# Altium project BOB.PrjPcb (part 1 of 2)
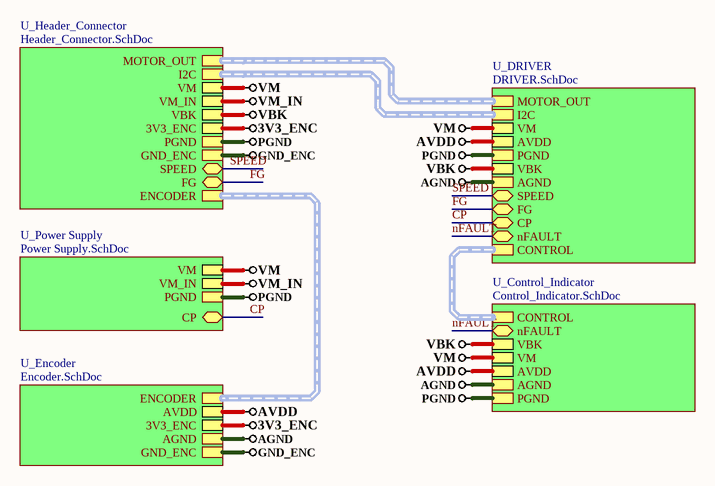
[diagram p0: Top_Sheet.SchDoc]
6 sheets, 57 parts. Net scope: hierarchical (ports join the sheet entries above them; power ports are global).
Board file: PCB_BOB.PcbDoc
Sheets:
  Top_Sheet.SchDoc
    U_Control_Indicator = Control_Indicator.SchDoc
    U_Encoder = Encoder.SchDoc
    U_Power Supply = Power Supply.SchDoc
    U_Header_Connector = Header_Connector.SchDoc
    U_DRIVER = DRIVER.SchDoc

## Sheet Top_Sheet.SchDoc
size A4; DocumentNumber: 1; SheetNumber: 1; SheetTotal: 6

### Sub-sheets
U_Control_Indicator = Control_Indicator.SchDoc: VM, AVDD, PGND, VBK, AGND, CONTROL (harness CONTROL), nFAULT (bidir)
U_DRIVER = DRIVER.SchDoc: I2C (harness I2C), VM, AVDD, PGND, VBK, AGND, CONTROL (harness CONTROL), FG (bidir), nFAULT (bidir), CP (bidir), SPEED (bidir), MOTOR_OUT (harness MOTOR_OUT)
U_Encoder = Encoder.SchDoc: ENCODER (harness ENCODER), AVDD, AGND, 3V3_ENC, GND_ENC
U_Header_Connector = Header_Connector.SchDoc: MOTOR_OUT (harness MOTOR_OUT), VM, VBK, VM_IN, I2C (harness I2C), FG (bidir), ENCODER (harness ENCODER), SPEED (bidir), 3V3_ENC, PGND, GND_ENC
U_Power Supply = Power Supply.SchDoc: VM, VM_IN, PGND, CP (bidir)

### Nets
3V3_ENC: sheet U_Encoder/3V3_ENC, sheet U_Header_Connector/3V3_ENC
AGND: sheet U_Control_Indicator/AGND, sheet U_Encoder/AGND, sheet U_DRIVER/AGND
AVDD: sheet U_Control_Indicator/AVDD, sheet U_Encoder/AVDD, sheet U_DRIVER/AVDD
GND_ENC: sheet U_Encoder/GND_ENC, sheet U_Header_Connector/GND_ENC
PGND: sheet U_Control_Indicator/PGND, sheet U_Power Supply/PGND, sheet U_Header_Connector/PGND, sheet U_DRIVER/PGND
VBK: sheet U_Control_Indicator/VBK, sheet U_Header_Connector/VBK, sheet U_DRIVER/VBK
VM: sheet U_Control_Indicator/VM, sheet U_Power Supply/VM, sheet U_Header_Connector/VM, sheet U_DRIVER/VM
VM_IN: sheet U_Power Supply/VM_IN, sheet U_Header_Connector/VM_IN
CP: sheet U_Power Supply/CP, sheet U_DRIVER/CP
FG: sheet U_Header_Connector/FG, sheet U_DRIVER/FG
nFAULT: sheet U_Control_Indicator/nFAULT, sheet U_DRIVER/nFAULT
SPEED: sheet U_Header_Connector/SPEED, sheet U_DRIVER/SPEED

### Buses and harness runs
harness sheet U_Control_Indicator/CONTROL = sheet U_DRIVER/CONTROL
harness sheet U_DRIVER/I2C = sheet U_Header_Connector/I2C
harness sheet U_DRIVER/MOTOR_OUT = sheet U_Header_Connector/MOTOR_OUT
harness sheet U_Encoder/ENCODER = sheet U_Header_Connector/ENCODER

### Notes on the sheet
- File:
- Title:
- Date:
- Page
- Num:
- Total:
- Drawn By: Huzaifa Ali

## Sheet Control_Indicator.SchDoc
size A4; DocumentNumber: 5; SheetNumber: 5; SheetTotal: 6
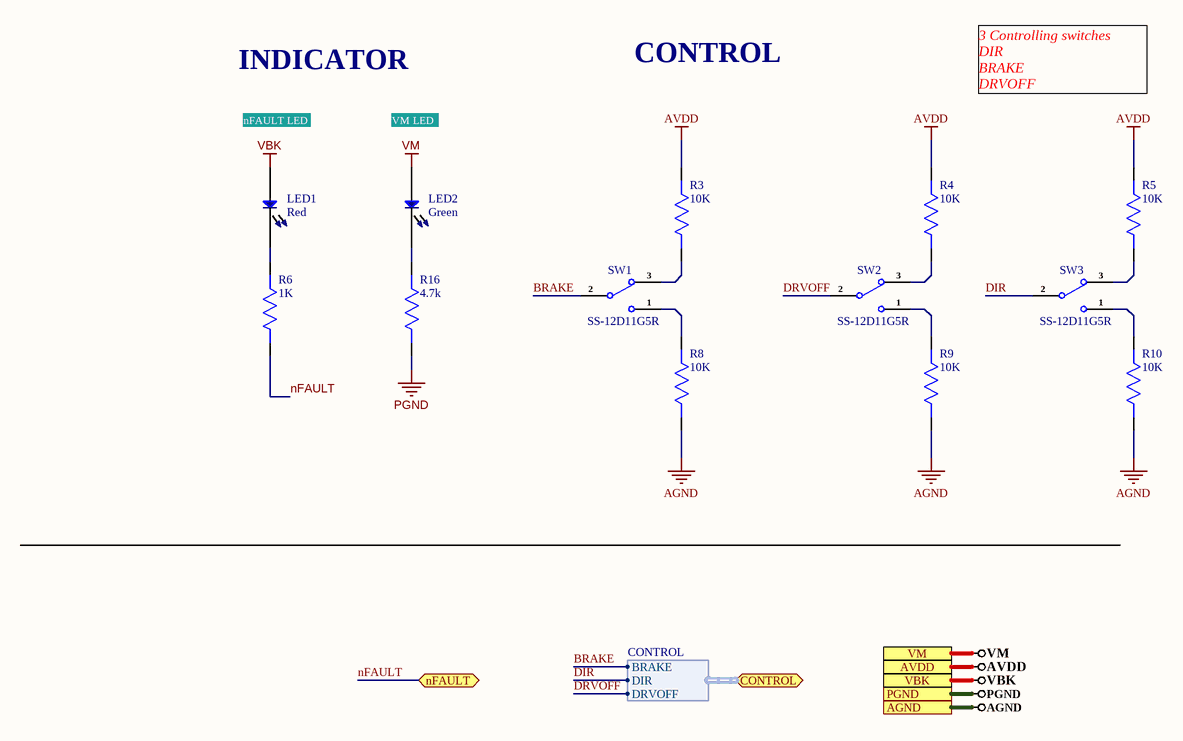
[diagram p1: Control_Indicator.SchDoc]

### Parts
LED1  Red  [LED 0402]
LED2  Green  [LED-0402]
R3  10K  [Res-0603]
R4  10K  [Res-0603]
R5  10K  [Res-0603]
R6  1K  [Res0402]
R8  10K  [Res-0603]
R9  10K  [Res-0603]
R10  10K  [Res-0603]
R16  4.7k  [RES-0805]
SW1  SS-12D11G5R  [SS-12D11G5R_]
SW2  SS-12D11G5R  [SS-12D11G5R_]
SW3  SS-12D11G5R  [SS-12D11G5R_]

### Ports
AGND, AVDD, CONTROL (bidir, harness CONTROL), nFAULT (bidir), PGND, VBK, VM

### Harnesses
CONTROL: BRAKE, DIR, DRVOFF

### Nets
AGND: R8.2 R9.2 R10.2 ; port AGND
AVDD: R3.1 R4.1 R5.1 ; port AVDD
PGND: R16.2 ; port PGND
VBK: LED1.1 ; port VBK
VM: LED2.1 ; port VM
BRAKE: SW1.2 ; port CONTROL.BRAKE
DIR: SW3.2 ; port CONTROL.DIR
DRVOFF: SW2.2 ; port CONTROL.DRVOFF
nFAULT: R6.2 ; port nFAULT
NetLED1_2: LED1.2 R6.1
NetLED2_2: LED2.2 R16.1
NetR3_2: R3.2 SW1.3
NetR4_2: R4.2 SW2.3
NetR5_2: R5.2 SW3.3
NetR8_1: R8.1 SW1.1
NetR9_1: R9.1 SW2.1
NetR10_1: R10.1 SW3.1

### Notes on the sheet
- INDICATOR
- CONTROL
- 3 Controlling switches
  DIR
  BRAKE
  DRVOFF
- nFAULT LED
- VM LED
- File:
- Title:
- Date:
- Page
- Num:
- Total:
- Drawn By: Huzaifa Ali

### Library data of the parts
LED1 = LTST-C281KRKT: Standard LEDs - SMD SMD LED Red 631nm 54mcd 130VA; Manufacturer: Vishay Lite-On; Lens Color: Colorless; Lens Style: Diffused,Colorless,Rectangular,Clear; Viewing Angle: 130°; Forward Current: 20mA; Forward Voltage: 2V; Lens Transparency: Clear; Number of Elements: 1; Power Dissipation: 62.5mW; Reverse Voltage: 5V; Supplier 1: Mouser; Manufacturer Part Number: LTST-C281KRKT; Stock 1: 2790; Pricing 1: 1=0.45, 10=0.25, 100=0.114, 1000=0.082, 3000=0.064, 9000=0.057 (USD); Mount: Surface Mount; Case/Package: 0402; Number of Pins: 2; Color: Red; Case Code (Metric): 1005; Case Code (Imperial): 0402; Min Operating Temperature: -30°C; Max Operating Temperature: 85°C; Package Quantity: 3000; Illumination Color: Red; Luminous Intensity: 54mcd; Packaging: Tape and Reel; Test Current: 20mA; Dominant Wavelength: 631nm; Number of LEDs: 1; Length: 1mm; Height: 0.35mm; Width: 0.5mm; Depth: 0.5mm; Lead Free: Lead Free; ComponentLink1URL: http://optoelectronics.liteon.com/ja-jp/api/DwonloadFileHandler.ashx?txtSpecNo=DS22-2008-0117&txtPartNo=LTST-C281KRKT&src-supplier=Avnet; ComponentLink1Description: http://optoelectronics.liteon.com/ja-jp/api/DwonloadFileHandler.ashx?txtSpecNo=DS22-2008-0117&txtPartNo=LTST-C281KRKT&src-supplier=Avnet; ComponentLink2URL: http://components.arrow.com/part/dataview/52218614S9812790N1331?src-supplier=Arrow; ComponentLink2Description: http://components.arrow.com/part/dataview/52218614S9812790N1331?src-supplier=Arrow; ComponentLink3URL: http://www.mouser.com/ds/2/239/LTST-C281KRKT-1141717.pdf?src-supplier=Mouser; ComponentLink3Description: http://www.mouser.com/ds/2/239/LTST-C281KRKT-1141717.pdf?src-supplier=Mouser; ComponentLink4URL: http://optoelectronics.liteon.com/upload/download/DS22-2008-0117/P_100_LTST-C281KRKT.pdf?src-supplier=Future+Electronics; ComponentLink4Description: http://optoelectronics.liteon.com/upload/download/DS22-2008-0117/P_100_LTST-C281KRKT.pdf?src-supplier=Future+Electronics; ComponentLink5URL: http://optoelectronics.liteon.com/upload/download/DS22-2008-0117/LTST-C281KRKT.pdf?src-supplier=Digi-Key; ComponentLink5Description: http://optoelectronics.liteon.com/upload/download/DS22-2008-0117/LTST-C281KRKT.pdf?src-supplier=Digi-Key; Supplier Part Number 1: 859-LTST-C281KRKT
LED2 = 16-213/GHC-YR1S1/3T: Green 520~535nm 0402 Light Emitting Diodes (LED) RoHS; Manufacturer: Everlight Elec; Luminous Intensity (IF=20mA): 112~285mcd; Package: 0402; Illumination Color: Green; Dominant Wavelength / Coordinate rank: 520~535nm; Mounting Type: Surface Mount; Manufacturer Part Number: 16-213/GHC-YR1S1/3T; ComponentLink1Description: LCSC; ComponentLink1URL: https://www.lcsc.com/product-detail/Light-Emitting-Diodes-LED_Everlight-Elec-16-213-GHC-YR1S1-3T_C74338.html; LCSC Part Number: C74338
R3-R5 R8-R10 = AC0603JR-0710KL: RES SMD 10K OHM 5% 1/10W 0603; Manufacturer: Yageo; Voltage Rating: 50V; Resistance: 10kR; Power Rating: 100mW; Temperature Coefficient: 100ppm/°C; Supplier 1: Future Electronics; Manufacturer Part Number: AC0603JR-0710KL; RoHS: Yes; Category: Chip SMD Resistors; Stock 1: 1533000; Pricing 1: 5000=0.00540 (USD); Case/Package: 0603; Case Code (Imperial): 0603; Case Code (Metric): 1608; Size Code: 0603; Min Operating Temperature: -55°C; Max Operating Temperature: 155°C; Packaging: Tape and Reel; Tolerance: 5%; Package Quantity: 1; Resistor Type: Thick Film; Termination: SMD/SMT; Number of Terminations: 2; Max Power Dissipation: 100mW; Features: Moisture Resistant,Automotive AEC-Q200,Anti-Sulfur; Series: AC; Construction: Rectangular; Length: 0.063inch; Width: 0.031inch; Height: 0.022inch; Depth: 0.8mm; Military Standard: Not; Lead Free: Lead Free; RoHS Compliant: Yes; ComponentLink1URL: https://datasheet.ciiva.com/5562/pyu-ac-51-rohs-l-2-5562553.pdf?src-supplier=Mouser; ComponentLink1Description: https://datasheet.ciiva.com/5562/pyu-ac-51-rohs-l-2-5562553.pdf?src-supplier=Mouser; Supplier Part Number 1: 1029044; LCSC Part Number: C140867
R6 = ERJ-2GEJ102X: RES SMD 1K OHM 5% 1/10W 0402; Manufacturer: Panasonic; Resistance: 1kR; Temperature Coefficient: 200ppm/°C; Voltage Rating: 50V; Power Rating: 100mW; Supplier 1: Digi-Key; Manufacturer Part Number: ERJ-2GEJ102X; Stock 1: 3855795; Pricing 1: 1=0.1, 10=0.032, 100=0.0129, 1000=0.00578, 2500=0.00502, 5000=0.00414 (USD); Mount: Surface Mount; Case/Package: 0402; Contact Plating: Tin; Case Code (Metric): 1005; Case Code (Imperial): 0402; Min Operating Temperature: -55°C; Max Operating Temperature: 155°C; Tolerance: 5%; Composition: Thick Film; Packaging: Tape and Reel; Package Quantity: 1; Number of Terminations: 2; Termination: SMD/SMT; Military Standard: Not; Max Power Dissipation: 100mW; Voltage Rating (DC): 50V; Features: Automotive AEC-Q200; Working Voltage: 50V; Length: 1mm; Height: 0.35mm; Width: 0.02inch; Depth: 0.5mm; Radiation Hardening: No; REACH SVHC: No SVHC; Lead Free: Lead Free; ComponentLink1URL: https://industrial.panasonic.com/cdbs/www-data/pdf/RDA0000/AOA0000C301.pdf?src-supplier=Future+Electronics; ComponentLink1Description: https://industrial.panasonic.com/cdbs/www-data/pdf/RDA0000/AOA0000C301.pdf?src-supplier=Future+Electronics; ComponentLink2URL: http://www.jameco.com/Jameco/Products/ProdDS/1986781.pdf?src-supplier=Jameco; ComponentLink2Description: http://www.jameco.com/Jameco/Products/ProdDS/1986781.pdf?src-supplier=Jameco; ComponentLink3URL: http://www.farnell.com/datasheets/2059623.pdf?src-supplier=Farnell; ComponentLink3Description: http://www.farnell.com/datasheets/2059623.pdf?src-supplier=Farnell; ComponentLink4URL: http://industrial.panasonic.com/www-data/pdf/AOA0000/AOA0000CE1.pdf?src-supplier=Avnet; ComponentLink4Description: http://industrial.panasonic.com/www-data/pdf/AOA0000/AOA0000CE1.pdf?src-supplier=Avnet; ComponentLink5URL: http://www.alliedelec.com/m/d/51cd0790071e1666bdb9d00c57fcf960.pdf?src-supplier=Allied+Electronics; ComponentLink5Description: http://www.alliedelec.com/m/d/51cd0790071e1666bdb9d00c57fcf960.pdf?src-supplier=Allied+Electronics; ComponentLink6URL: http://industrial.panasonic.com/www-data/pdf/AOA0000/AOA0000CE1.pdf?src-supplier=Avnet+Europe; ComponentLink6Description: http://industrial.panasonic.com/www-data/pdf/AOA0000/AOA0000CE1.pdf?src-supplier=Avnet+Europe; ComponentLink7URL: http://www.farnell.com/datasheets/2059623.pdf?src-supplier=Element14; ComponentLink7Description: http://www.farnell.com/datasheets/2059623.pdf?src-supplier=Element14; ComponentLink8URL: http://industrial.panasonic.com/cdbs/www-data/pdf/RDA0000/AOA0000C301.pdf?src-supplier=Farnell; ComponentLink8Description: http://industrial.panasonic.com/cdbs/www-data/pdf/RDA0000/AOA0000C301.pdf?src-supplier=Farnell; ComponentLink9URL: http://industrial.panasonic.com/www-data/pdf/AOA0000/AOA0000CE1.pdf?src-supplier=Avnet+Asia; ComponentLink9Description: http://industrial.panasonic.com/www-data/pdf/AOA0000/AOA0000CE1.pdf?src-supplier=Avnet+Asia; Supplier Part Number 1: P1.0KJCT-ND
R16 = CRCW08054K70FKEAHP: Res Thick Film 0805 4.7K Ohm 1% 0.5W ±100ppm/°C Molded SMD SMD Paper T/R; Manufacturer: Vishay; Power Rating: 330mW; Voltage Rating: 150V; Resistance: 4.7kR; Max Power Dissipation: 500mW; Item Type: Resistor; Supplier 1: RSComponents; Manufacturer Part Number: CRCW08054K70FKEAHP; RoHS: Yes; Category: Chip SMD Resistors; Stock 1: 8150; Pricing 1: 100=0.15700, 250=0.14600, 500=0.13600, 1000=0.12500 (GBP); Mount: Surface Mount; Case/Package: 0805; Weight: 0.000194oz; Case Code (Imperial): 0805; Case Code (Metric): 2012; Contact Plating: Tin; Min Operating Temperature: -55°C; Max Operating Temperature: 155°C; Tolerance: 1%; Packaging: Tape and Reel; Package Quantity: 5000; Resistor Type: Thick Film; Termination: SMD/SMT; Temperature Coefficient: 100ppm/°C; Voltage Rating (DC): 150V; Features: Automotive AEC-Q200; Series: CRCW-HP; Number of Terminations: 2; Resistance Tolerance: 1%; Construction: Rectangular; Technology: THICK FILM; Length: 2mm; Width: 1.2mm; Height: 0.5mm; Depth: 1.25mm; Ratings: AEC-Q200; Radiation Hardening: No; Military Standard: Not; Lead Free: Lead Free; RoHS Compliant: Yes; ComponentLink1URL: https://datasheet.ciiva.com/8079/424479-8079653.pdf?src-supplier=Element14; ComponentLink1Description: https://datasheet.ciiva.com/8079/424479-8079653.pdf?src-supplier=Element14; ComponentLink2URL: https://datasheet.ciiva.com/9072/crcwhpe3-9072073.pdf?src-supplier=Avnet; ComponentLink2Description: https://datasheet.ciiva.com/9072/crcwhpe3-9072073.pdf?src-supplier=Avnet; LCSC Part Number: C313926; Supplier Part Number 1: 8123574P
SW1-SW3 = SS-12D11G5R: Shrouded 5A SPDT 125V 6.3mm 13.5mm 125V 6.6mm 5A PCPin 10000 Rectangular columnar -40℃~+85℃ Black Plugin Slide Switches ROHS; Manufacturer: XKB Connectivity; Manufacturer Part Number: SS-12D11G5R; Package: Custom; LCSC Part Number: C388633; ComponentLink1Description: LCSC; ComponentLink1URL: https://www.lcsc.com/product-detail/Slide-Switches_XKB-Connectivity-SS-12D11G5R_C388633.html

## Sheet Encoder.SchDoc
size A4; DocumentNumber: 4; SheetNumber: 4; SheetTotal: 6
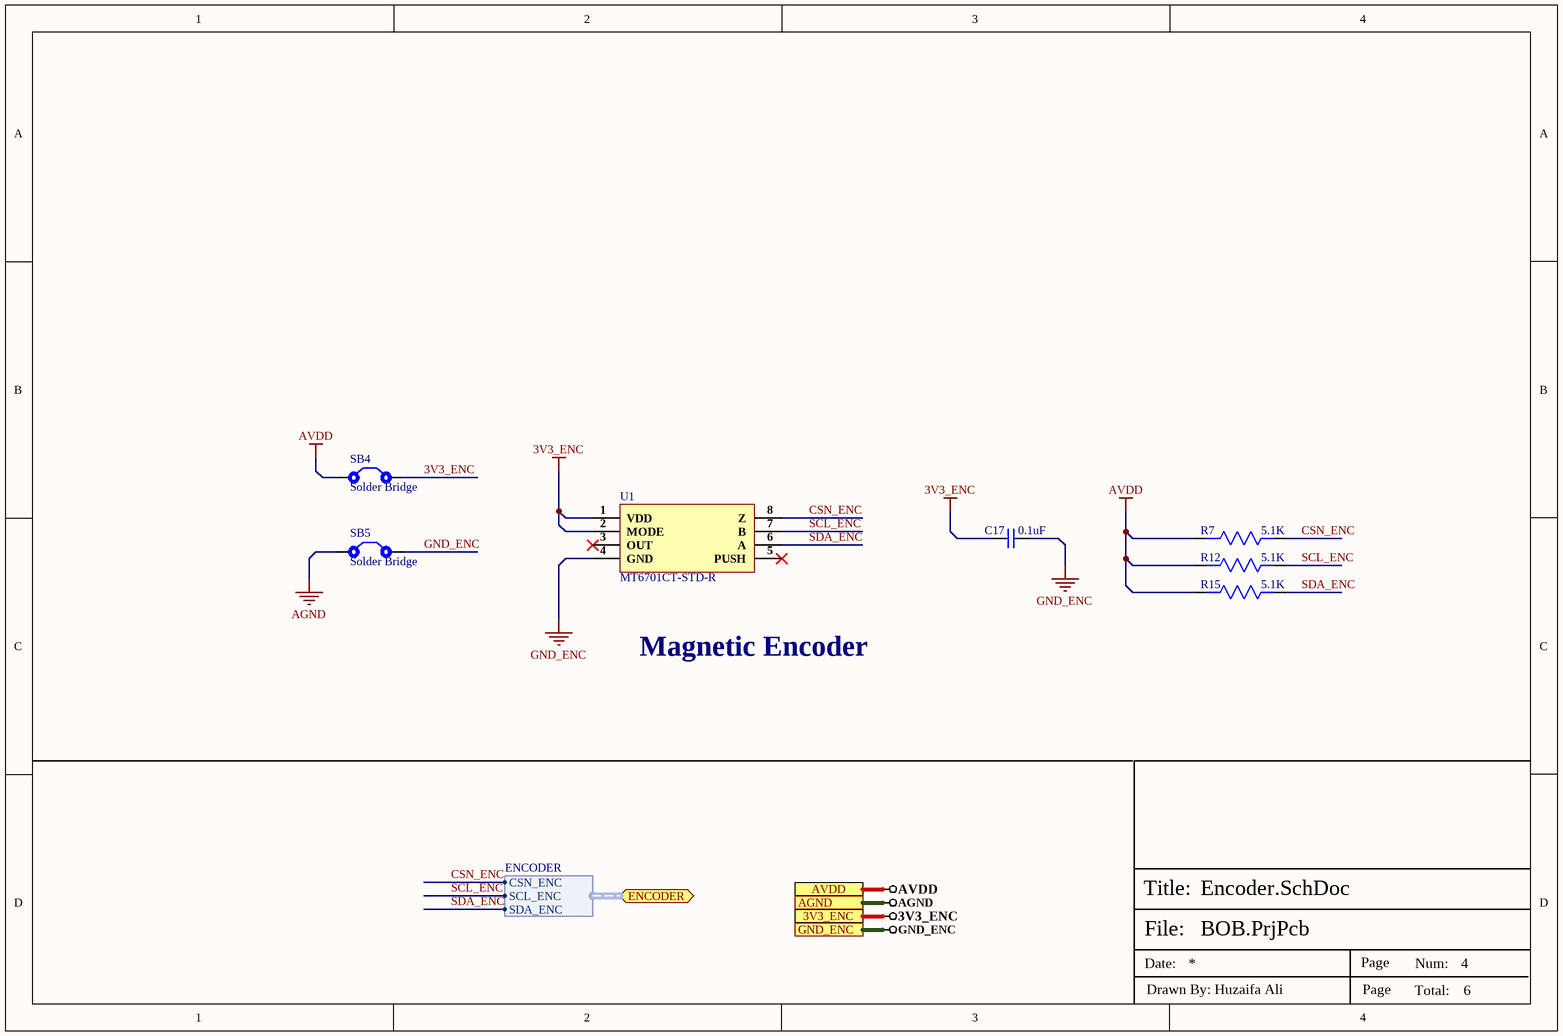
[diagram p2: Encoder.SchDoc]

### Parts
C17  0.1uF  [Cap-0603]
R7  5.1K  [Res-0603]
R12  5.1K  [Res-0603]
R15  5.1K  [Res-0603]
SB4  Solder Bridge  [Solder Bridge]
SB5  Solder Bridge  [Solder Bridge]
U1  MT6701CT-STD-R  [SOP-8]

### Ports
3V3_ENC, AGND, AVDD, ENCODER (bidir, harness ENCODER), GND_ENC

### Harnesses
ENCODER: CSN_ENC, SCL_ENC, SDA_ENC

### Nets
3V3_ENC: C17.1 SB4.2 U1.1(VDD) U1.2(MODE) ; port 3V3_ENC
AGND: SB5.1 ; port AGND
AVDD: R7.2 R12.2 R15.2 SB4.1 ; port AVDD
GND_ENC: C17.2 SB5.2 U1.4(GND) ; port GND_ENC
CSN_ENC: R7.1 U1.8(Z) ; port ENCODER.CSN_ENC
SCL_ENC: R12.1 U1.7(B) ; port ENCODER.SCL_ENC
SDA_ENC: R15.1 U1.6(A) ; port ENCODER.SDA_ENC

Not connected (* = marked no-connect by the designer): U1 3(OUT)* 5(PUSH)*

### Notes on the sheet
- Magnetic Encoder
- File:
- Title:
- Date:
- Page
- Num:
- Total:
- Drawn By: Huzaifa Ali

### Library data of the parts
C17 = CC0603KRX7R0BB104: CAP CER 0.1UF 100V X7R 0603; Manufacturer: Yageo; Capacitance: 100nF; Tolerance: 10%; Supplier 1: Digi-Key; Manufacturer Part Number: CC0603KRX7R0BB104; RoHS: Yes; Category: Ceramic Capacitors; Stock 1: 60476; Pricing 1: 1=0.19000, 10=0.13500, 50=0.07680, 100=0.06370, 500=0.04466, 1000=0.03696 (USD); Mount: Surface Mount; Case/Package: 0603; Case Code (Metric): 1608; Case Code (Imperial): 0603; Weight: 7.1E-05oz; Min Operating Temperature: -55°C; Max Operating Temperature: 125°C; Package Quantity: 4000; Voltage Rating: 100V; Packaging: Tape and Reel; Dielectric: X7R; Termination: SMD/SMT; Resistor Type: Ceramic; Voltage Rating (DC): 100V; Series: CC; Length: 0.063inch; Width: 0.031inch; Thickness: 0.035inch; Depth: 0.8mm; Lead Free: Lead Free; RoHS Compliant: Yes; ComponentLink1URL: https://datasheet.ciiva.com/6277/mlccorderingcode-6277030.pdf?src-supplier=Digi-Key; ComponentLink1Description: https://datasheet.ciiva.com/6277/mlccorderingcode-6277030.pdf?src-supplier=Digi-Key; ComponentLink2URL: https://datasheet.ciiva.com/6277/mlccorderingcode-6277081.pdf?src-supplier=Digi-Key; ComponentLink2Description: https://datasheet.ciiva.com/6277/mlccorderingcode-6277081.pdf?src-supplier=Digi-Key; ComponentLink3URL: https://datasheet.ciiva.com/6277/mlccorderingcode-6277082.pdf?src-supplier=Digi-Key; ComponentLink3Description: https://datasheet.ciiva.com/6277/mlccorderingcode-6277082.pdf?src-supplier=Digi-Key; Supplier Part Number 1: 311-1523-1-ND; LCSC Part Number: C113803
R7 R12 R15 = RC0603JR-075K1L: RES SMD 5.1K OHM 5% 1/10W 0603; Manufacturer: Yageo; Resistance: 5.1kR; Power Rating: 100mW; Voltage Rating: 50V; Temperature Coefficient: 100ppm/°C; Supplier 1: Digi-Key; Manufacturer Part Number: RC0603JR-075K1L; RoHS: Yes; Category: Chip SMD Resistors; Stock 1: 245818; Pricing 1: 1=0.10000, 10=0.02000, 100=0.00800, 1000=0.00360, 2500=0.00312 (USD); Case/Package: 0603; Number of Pins: 2; Case Code (Imperial): 0603; Case Code (Metric): 1608; Size Code: 0603; Min Operating Temperature: -55°C; Max Operating Temperature: 155°C; Tolerance: 5%; Packaging: Tape and Reel; Termination: SMD/SMT; Resistor Type: Thick Film; Voltage Rating (DC): 50V; Features: Moisture Resistant; Series: RC; Max Power Dissipation: 100mW; Number of Terminations: 2; Resistance Tolerance: 5%; Construction: Rectangular; Length: 1.6mm; Depth: 0.8mm; REACH SVHC: No SVHC; Military Standard: Not; Lead Free: Lead Free; RoHS Compliant: Yes; ComponentLink1URL: http://www.mouser.com/ds/2/447/RC0603-272842.pdf?src-supplier=Mouser; ComponentLink1Description: http://www.mouser.com/ds/2/447/RC0603-272842.pdf?src-supplier=Mouser; ComponentLink2URL: http://components.arrow.com/part/dataview/0323_00047491?src-supplier=Arrow+Europe; ComponentLink2Description: http://components.arrow.com/part/dataview/0323_00047491?src-supplier=Arrow+Europe; ComponentLink3URL: http://www.farnell.com/datasheets/2167052.pdf?src-supplier=Farnell; ComponentLink3Description: http://www.farnell.com/datasheets/2167052.pdf?src-supplier=Farnell; ComponentLink4URL: http://www.farnell.com/datasheets/2167052.pdf?src-supplier=Element14; ComponentLink4Description: http://www.farnell.com/datasheets/2167052.pdf?src-supplier=Element14; ComponentLink5URL: http://www.farnell.com/datasheets/2167052.pdf?src-supplier=Newark; ComponentLink5Description: http://www.farnell.com/datasheets/2167052.pdf?src-supplier=Newark; ComponentLink6URL: http://www.farnell.com/datasheets/1868787.pdf?src-supplier=Newark; ComponentLink6Description: http://www.farnell.com/datasheets/1868787.pdf?src-supplier=Newark; ComponentLink7URL: http://www.yageo.com/documents/recent/PYu-RC_Group_51_RoHS_L_10.pdf?src-supplier=Digi-Key; ComponentLink7Description: http://www.yageo.com/documents/recent/PYu-RC_Group_51_RoHS_L_10.pdf?src-supplier=Digi-Key; ComponentLink8URL: http://www.yageo.com/documents/recent/PYu-RC0603_51_RoHS_L_7.pdf?src-supplier=Future+Electronics; ComponentLink8Description: http://www.yageo.com/documents/recent/PYu-RC0603_51_RoHS_L_7.pdf?src-supplier=Future+Electronics; Supplier Part Number 1: 311-5.1KGRCT-ND; LCSC Part Number: C14677
SB4 SB5 = Solder Bridge: Solder Bridge ON
U1 = MT6701CT-STD-R: SOP-8 Position Sensor ROHS; Manufacturer: Magn Tek; Manufacturer Part Number: MT6701CT-STD-R; Package: SOP-8; ComponentLink1Description: LCSC; ComponentLink1URL: https://www.lcsc.com/product-detail/Position-Sensor_Magn-Tek-MT6701CT-STD-R_C3003196.html

## Sheet Power Supply.SchDoc
size A4; DocumentNumber: 2; SheetNumber: 2; SheetTotal: 6
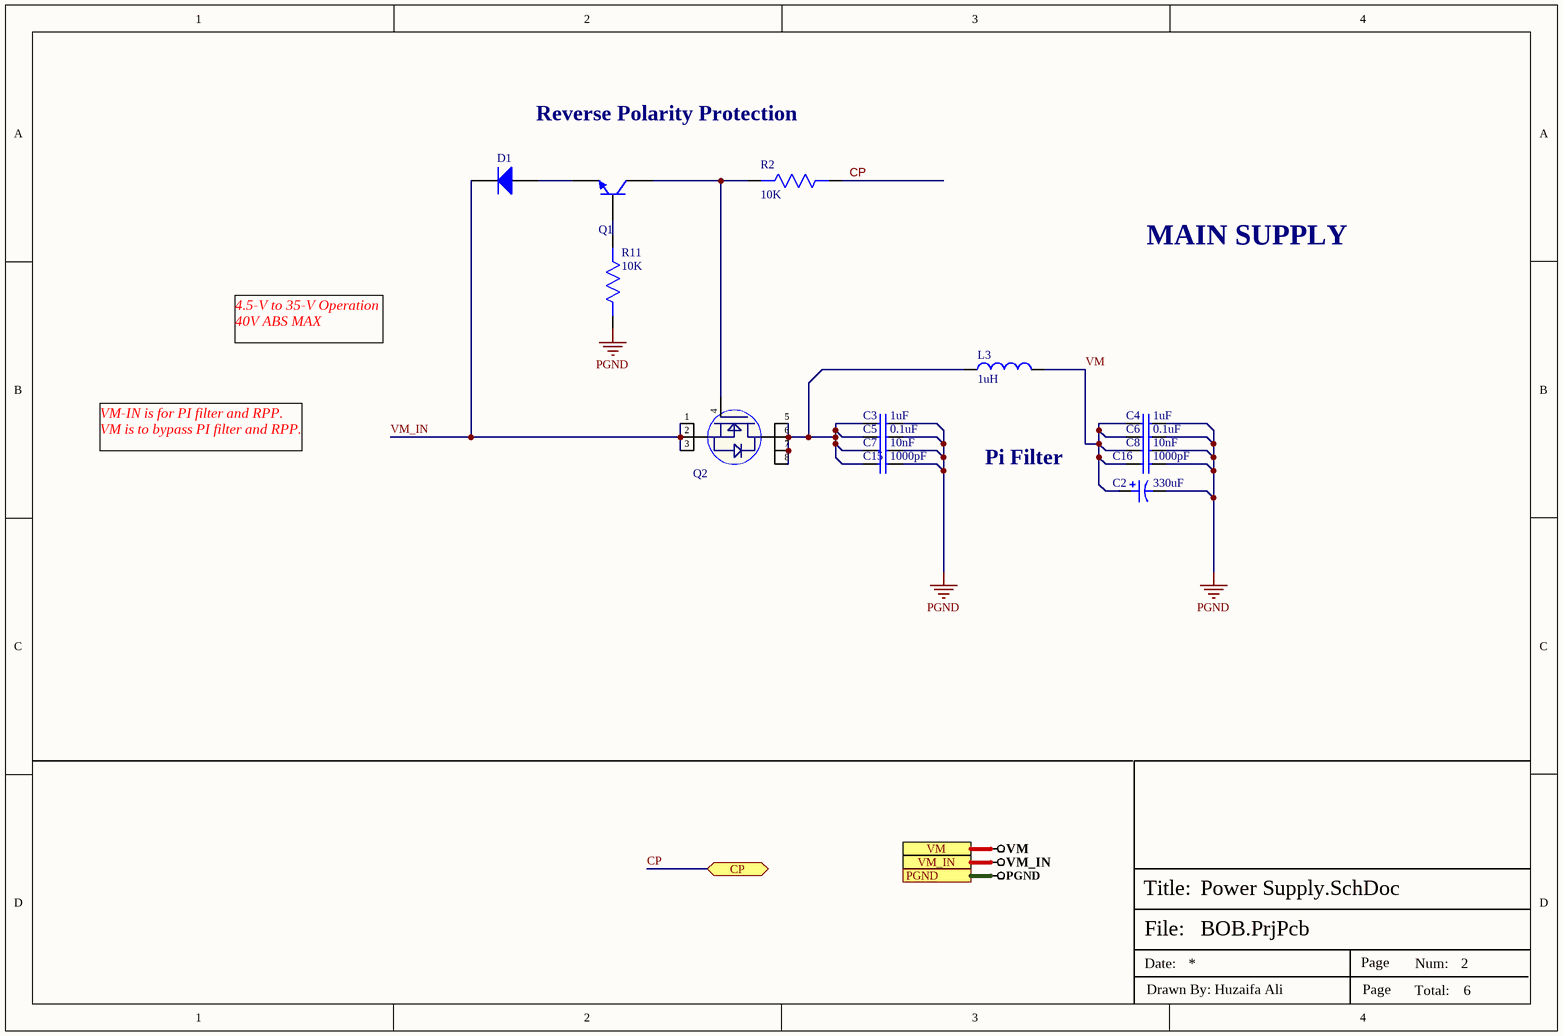
[diagram p3: Power Supply.SchDoc]

### Parts
C2  330uF  [VZT-330uF-10mmDia]
C3  1uF  [Cap-1206]
C4  1uF  [Cap-1206]
C5  0.1uF  [Cap-0603]
C6  0.1uF  [Cap-0603]
C7  10nF  [Cap-0603]
C8  10nF  [Cap-0603]
C15  1000pF  [Cap-0402]
C16  1000pF  [Cap-0402]
D1  S1A-13-F  [SMA]  (value not drawn)
L3  1uH  [WPN4020H1R0MT_]
Q1  LH8050QLT1G  [SOT-23-3L_]  (value not drawn)
Q2  NCE6008AS  [SOP-8]  (value not drawn)
R2  10K  [Res-0603]
R11  10K  [Res-0603]

### Ports
CP (bidir), PGND, VM, VM_IN

### Nets
PGND: C2.2 C3.1 C4.1 C5.1 C6.1 C7.2 C8.2 C15.1 C16.1 R11.2 ; port PGND
VM: C2.1 C4.2 C6.2 C8.1 C16.2 L3.2 ; port VM
VM_IN: D1.1 Q2.1(S) Q2.2(S) Q2.3(S) ; port VM_IN
CP: R2.1 ; port CP
NetC3_2: C3.2 C5.2 C7.1 C15.2 L3.1 Q2.5(D) Q2.6(D) Q2.7(D) Q2.8(D)
NetD1_2: D1.2 Q1.2(E)
NetQ1_1: Q1.1(B) R11.1
NetQ1_3: Q1.3(C) Q2.4(G) R2.2

### Notes on the sheet
- Reverse Polarity Protection
- MAIN SUPPLY
- 4.5-V to 35-V Operation
  40V ABS MAX
- VM-IN is for PI filter and RPP.
  VM is to bypass PI filter and RPP.
- Pi Filter
- File:
- Title:
- Date:
- Page
- Num:
- Total:
- Drawn By: Huzaifa Ali

### Library data of the parts
C2 = VZT331M1HTR-1010: VZT Series 50 V 330 uF 105°C 10 x 10 mm SMT Aluminum Electrolytic Capacitor; Manufacturer: Surge Components; Manufacturer Part Number: VZT331M1HTR-1010S; Supplier 1: Future Electronics; RoHS: Yes; Stock 1: 35000; Pricing 1: 500=0.28000, 1500=0.27000, 2000=0.26500, 5000=0.26000, 7500=0.25000 (USD); Lead Free: Lead Free; Supplier Part Number 1: 8161943
C3 C4 = GRM31CR72A105KA01K: CAP CER 1UF 100V X7R 1206; Manufacturer: Murata; Tolerance: 10%; Supplier 1: Digi-Key; Manufacturer Part Number: GRM31CR72A105KA01K; RoHS: Yes; Category: Ceramic Capacitors; Stock 1: 11842; Pricing 1: 1=0.48000, 10=0.33000, 50=0.23100, 100=0.19800, 500=0.14850, 1000=0.12540, 2500=0.11880 (USD); Mount: Surface Mount; Case/Package: 1206; Case Code (Imperial): 1206; Case Code (Metric): 3216; Min Operating Temperature: -55°C; Max Operating Temperature: 125°C; Capacitance: 1uF; Voltage Rating: 100V; Voltage Rating (DC): 100V; Packaging: Tape and Reel; Package Quantity: 1; Dielectric: X7R; Termination: SMD/SMT; Series: GRM; Construction: Flat; Length: 3.2mm; Width: 1.6mm; Height: 1.6mm; Thickness: 0.071inch; Depth: 1.6mm; Radiation Hardening: No; RoHS Compliant: Yes; ComponentLink1URL: https://datasheet.ciiva.com/11616/product-11616604.pdf?src-supplier=Avnet; ComponentLink1Description: https://datasheet.ciiva.com/11616/product-11616604.pdf?src-supplier=Avnet; ComponentLink2URL: https://datasheet.ciiva.com/6264/partnumbering-e-01-6264397.pdf?src-supplier=Digi-Key; ComponentLink2Description: https://datasheet.ciiva.com/6264/partnumbering-e-01-6264397.pdf?src-supplier=Digi-Key; ComponentLink3URL: https://datasheet.ciiva.com/6264/partnumbering-e-01-6264398.pdf?src-supplier=Digi-Key; ComponentLink3Description: https://datasheet.ciiva.com/6264/partnumbering-e-01-6264398.pdf?src-supplier=Digi-Key; ComponentLink4URL: https://datasheet.ciiva.com/6264/partnumbering-e-01-6264399.pdf?src-supplier=Digi-Key; ComponentLink4Description: https://datasheet.ciiva.com/6264/partnumbering-e-01-6264399.pdf?src-supplier=Digi-Key; Supplier Part Number 1: 490-6523-1-ND; LCSC Part Number: C909823
C5 C6 = CC0603KRX7R0BB104: as C17 on sheet Encoder; Supplier 1: Digi-Key; Manufacturer Part Number: CC0603KRX7R0BB104; RoHS: Yes; Category: Ceramic Capacitors; Stock 1: 60476; Pricing 1: 1=0.19000, 10=0.13500, 50=0.07680, 100=0.06370, 500=0.04466, 1000=0.03696 (USD); Mount: Surface Mount; Case/Package: 0603; Case Code (Metric): 1608; Case Code (Imperial): 0603; Weight: 7.1E-05oz; Min Operating Temperature: -55°C; Max Operating Temperature: 125°C; Package Quantity: 4000; Voltage Rating: 100V; Packaging: Tape and Reel; Dielectric: X7R; Termination: SMD/SMT; Resistor Type: Ceramic; Voltage Rating (DC): 100V; Series: CC; Length: 0.063inch; Width: 0.031inch; Thickness: 0.035inch; Depth: 0.8mm; Lead Free: Lead Free; RoHS Compliant: Yes; ComponentLink1URL: https://datasheet.ciiva.com/6277/mlccorderingcode-6277030.pdf?src-supplier=Digi-Key; ComponentLink1Description: https://datasheet.ciiva.com/6277/mlccorderingcode-6277030.pdf?src-supplier=Digi-Key; ComponentLink2URL: https://datasheet.ciiva.com/6277/mlccorderingcode-6277081.pdf?src-supplier=Digi-Key; ComponentLink2Description: https://datasheet.ciiva.com/6277/mlccorderingcode-6277081.pdf?src-supplier=Digi-Key; ComponentLink3URL: https://datasheet.ciiva.com/6277/mlccorderingcode-6277082.pdf?src-supplier=Digi-Key; ComponentLink3Description: https://datasheet.ciiva.com/6277/mlccorderingcode-6277082.pdf?src-supplier=Digi-Key; Supplier Part Number 1: 311-1523-1-ND; LCSC Part Number: C113803
C7 C8 = AC0603KRX7R0BB103: 100V 10nF X7R ±10% 0603 Multilayer Ceramic Capacitors MLCC - SMD/SMT ROHS
C15 C16 = 885012205080: CAP CER 1000PF 100V X7R 0402; Manufacturer: Wurth Electronics; Supplier 1: Digi-Key; Manufacturer Part Number: 885012205080; RoHS: Yes; Stock 1: 13604; Pricing 1: 1=0.10000, 10=0.01900, 100=0.01730, 500=0.01532 (USD); ComponentLink1URL: https://katalog.we-online.de/pbs/datasheet/885012205080.pdf?src-supplier=Digi-Key; ComponentLink1Description: https://katalog.we-online.de/pbs/datasheet/885012205080.pdf?src-supplier=Digi-Key; Supplier Part Number 1: 732-12243-1-ND; LCSC Part Number: C2176546
D1 = S1A-13-F: Diode Switching 50V 1A 2-Pin SMA T/R; Manufacturer: Diodes; Element Configuration: Single; Reverse Recovery Time: 3us; Peak Non-Repetitive Surge Current: 30A; Max Reverse Current: 5uA; Forward Voltage: 1.1V; Recovery Time: 1.8us; Polarity: Standard; Capacitance: 10pF; ComponentLink1URL: http://www.mouser.com/ds/2/115/ds16008-60440.pdf?src-supplier=Mouser; ComponentLink1Description: http://www.mouser.com/ds/2/115/ds16008-60440.pdf?src-supplier=Mouser; ComponentLink2URL: http://www.diodes.com///datasheets/ds16008.pdf?src-supplier=Avnet; ComponentLink2Description: http://www.diodes.com///datasheets/ds16008.pdf?src-supplier=Avnet; ComponentLink3URL: http://www.te.com/commerce/DocumentDelivery/DDEController?Action=showdoc&DocId=Data+Sheet%7FRPII%2F2%7F0415%7Fpdf%7FEnglish%7FENG_DS_RPIIX2_0415.pdf&src-supplier=Digi-Key; ComponentLink3Description: http://www.te.com/commerce/DocumentDelivery/DDEController?Action=showdoc&DocId=Data+Sheet%7FRPII%2F2%7F0415%7Fpdf%7FEnglish%7FENG_DS_RPIIX2_0415.pdf&src-supplier=Digi-Key; ComponentLink4URL: https://www.diodes.com/assets/Datasheets/ds16008.pdf?src-supplier=Digi-Key; ComponentLink4Description: https://www.diodes.com/assets/Datasheets/ds16008.pdf?src-supplier=Digi-Key; Supplier 1: Digi-Key; Manufacturer Part Number: S1A-13-F; RoHS: Yes; Category: Rectifier Diodes; Stock 1: 647079; Pricing 1: 1=0.26000, 10=0.21300, 100=0.11290, 500=0.07424, 1000=0.05049, 2000=0.04554 (USD); Mount: Surface Mount; Case/Package: SMA; Number of Pins: 2; Weight: 0.002258oz; Min Operating Temperature: -65°C; Max Operating Temperature: 150°C; Forward Current: 1A; Max Repetitive Reverse Voltage (Vrrm): 50V; Packaging: Tape and Reel; Package Quantity: 5000; Max Surge Current: 30A; Reverse Voltage (DC): 50V; Average Rectified Current: 1A; Voltage Rating (DC): 50V; Current Rating: 1A; Output Current: 1A; Max Reverse Voltage (DC): 50V; Max Forward Surge Current (Ifsm): 30A; Termination: SMD/SMT; Series: -; Length: 4.6mm; Width: 2.92mm; Height: 2.1mm; Radiation Hardening: No; Lead Free: Lead Free; REACH SVHC: No SVHC; RoHS Compliant: Yes; ComponentLink5URL: https://datasheet.ciiva.com/911/ds16003-911872.pdf?src-supplier=Digi-Key; ComponentLink5Description: https://datasheet.ciiva.com/911/ds16003-911872.pdf?src-supplier=Digi-Key; ComponentLink6URL: https://datasheet.ciiva.com/27052/1541520-27052419.pdf?src-supplier=Jameco; ComponentLink6Description: https://datasheet.ciiva.com/27052/1541520-27052419.pdf?src-supplier=Jameco; ComponentLink7URL: https://datasheet.ciiva.com/22695/1911706-22695830.pdf?src-supplier=Element14; ComponentLink7Description: https://datasheet.ciiva.com/22695/1911706-22695830.pdf?src-supplier=Element14; ComponentLink8URL: https://datasheet.ciiva.com/16199/ds16003-16199336.pdf?src-supplier=Future+Electronics; ComponentLink8Description: https://datasheet.ciiva.com/16199/ds16003-16199336.pdf?src-supplier=Future+Electronics; ComponentLink9URL: https://datasheet.ciiva.com/4453/ds16003-83672-4453580.pdf?src-supplier=Mouser; ComponentLink9Description: https://datasheet.ciiva.com/4453/ds16003-83672-4453580.pdf?src-supplier=Mouser; ComponentLink10URL: https://datasheet.ciiva.com/25953/ds16003-25953033.pdf?src-supplier=Avnet+Europe; ComponentLink10Description: https://datasheet.ciiva.com/25953/ds16003-25953033.pdf?src-supplier=Avnet+Europe; ComponentLink11URL: https://datasheet.ciiva.com/8301/ds16003-8301429.pdf?src-supplier=Avnet; ComponentLink11Description: https://datasheet.ciiva.com/8301/ds16003-8301429.pdf?src-supplier=Avnet; Supplier Part Number 1: S1A-FDICT-ND; LCSC Part Number: C150735
L3 = WPN4020H1R0MT: FIXED IND 1UH 5.8A 26 MOHM SMD; Manufacturer: Sunlord; Supplier 1: Digi-Key; Manufacturer Part Number: WPN4020H1R0MT; RoHS: Yes; Category: Fixed Inductors; Supplier Part Number 1: 3442-WPN4020H1R0MTTR-ND; LCSC Part Number: C98359
Q1 = LH8050QLT1G: 100nA 50V 225mW 1.5A 500mV@800mA,80mA NPN -55℃~+150℃@(Tj) SOT-23(SOT-23-3) Bipolar Transistors - BJT ROHS
Q2 = NCE6008AS: 60V 8A 2.1W 20mΩ@10V,8A 2.2V@250uA N Channel SOP-8 MOSFETs ROHS
R2 R11 = AC0603JR-0710KL: as R3 on sheet Control_Indicator; Supplier 1: Future Electronics; Manufacturer Part Number: AC0603JR-0710KL; RoHS: Yes; Category: Chip SMD Resistors; Stock 1: 1533000; Pricing 1: 5000=0.00540 (USD); Case/Package: 0603; Case Code (Imperial): 0603; Case Code (Metric): 1608; Size Code: 0603; Min Operating Temperature: -55°C; Max Operating Temperature: 155°C; Packaging: Tape and Reel; Tolerance: 5%; Package Quantity: 1; Resistor Type: Thick Film; Termination: SMD/SMT; Number of Terminations: 2; Max Power Dissipation: 100mW; Features: Moisture Resistant,Automotive AEC-Q200,Anti-Sulfur; Series: AC; Construction: Rectangular; Length: 0.063inch; Width: 0.031inch; Height: 0.022inch; Depth: 0.8mm; Military Standard: Not; Lead Free: Lead Free; RoHS Compliant: Yes; ComponentLink1URL: https://datasheet.ciiva.com/5562/pyu-ac-51-rohs-l-2-5562553.pdf?src-supplier=Mouser; ComponentLink1Description: https://datasheet.ciiva.com/5562/pyu-ac-51-rohs-l-2-5562553.pdf?src-supplier=Mouser; Supplier Part Number 1: 1029044; LCSC Part Number: C140867

## Sheet Header_Connector.SchDoc
size A4; SheetNumber: 6; SheetTotal: 6
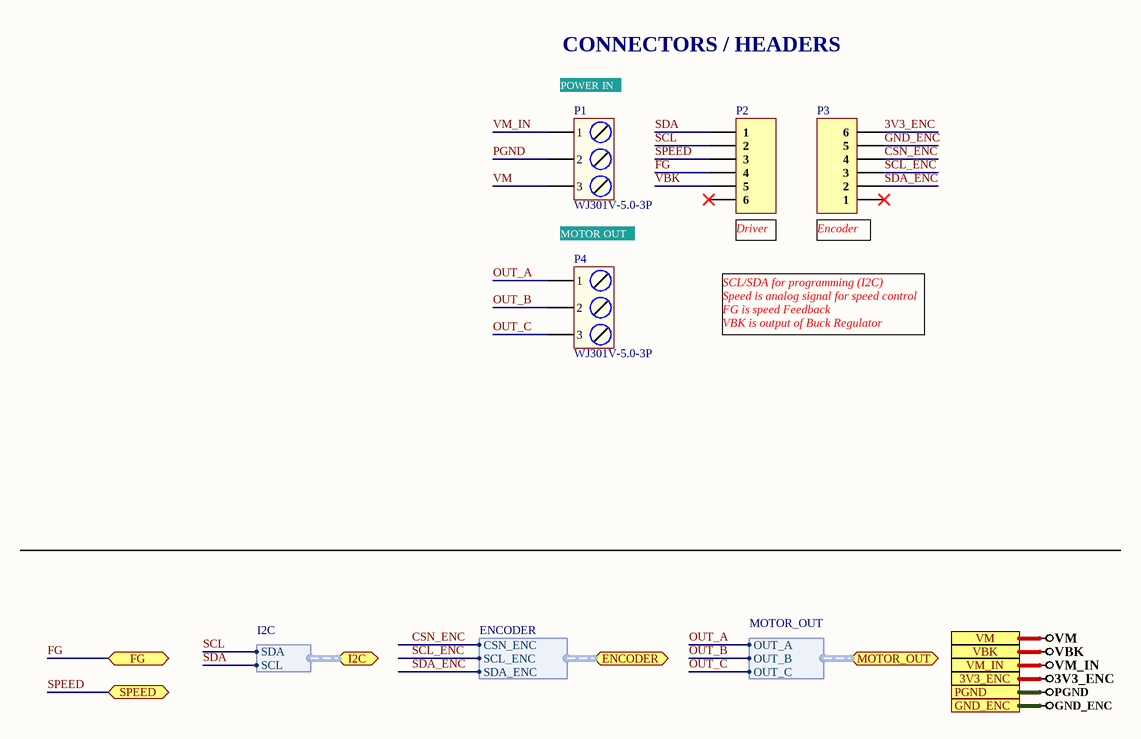
[diagram p4: Header_Connector.SchDoc]

### Parts
P1  WJ301V-5.0-3P  [WJ301V-5.0-3P]
P2  61300611121  [HDR1X6_]  (value not drawn)
P3  61300611121  [HDR1X6_]  (value not drawn)
P4  WJ301V-5.0-3P  [WJ301V-5.0-3P]

### Ports
3V3_ENC, ENCODER (bidir, harness ENCODER), FG (bidir), GND_ENC, I2C (bidir, harness I2C), MOTOR_OUT (bidir, harness MOTOR_OUT), PGND, SPEED (bidir), VBK, VM, VM_IN

### Harnesses
MOTOR_OUT: OUT_A, OUT_B, OUT_C
I2C: SDA, SCL
ENCODER: CSN_ENC, SCL_ENC, SDA_ENC

### Nets
3V3_ENC: P3.6 ; port 3V3_ENC
GND_ENC: P3.5 ; port GND_ENC
PGND: P1.2 ; port PGND
VBK: P2.5 ; port VBK
VM: P1.3 ; port VM
VM_IN: P1.1 ; port VM_IN
CSN_ENC: P3.4 ; port ENCODER.CSN_ENC
FG: P2.4 ; port FG
OUT_A: P4.1 ; port MOTOR_OUT.OUT_A
OUT_B: P4.2 ; port MOTOR_OUT.OUT_B
OUT_C: P4.3 ; port MOTOR_OUT.OUT_C
SCL: P2.2 ; port I2C.SDA
SCL_ENC: P3.3 ; port ENCODER.SCL_ENC
SDA: P2.1 ; port I2C.SCL
SDA_ENC: P3.2 ; port ENCODER.SDA_ENC
SPEED: P2.3 ; port SPEED

Not connected (* = marked no-connect by the designer): P2 6*; P3 1*

### Notes on the sheet
- CONNECTORS / HEADERS
- (near P1) POWER IN
- MOTOR OUT
- (near P2) Driver
- (near P3) Encoder
- SCL/SDA for programming (I2C)
  Speed is analog signal for speed control
  FG is speed Feedback
  VBK is output of Buck Regulator
- File:
- Title:
- Date:
- Page
- Num:
- Total:
- Drawn By: Huzaifa Ali

### Library data of the parts
P1 P4 = WJ301V-5.0-3P: P=5.0mm Screw terminal RoHS; Manufacturer: Ningbo Kangnex Elec; Value: Custom; Manufacturer Part No: WJ301V-5.0-3P; Package: Custom
P2 P3 = 61300611121: CONN HEADER 6 POS 2.54; Manufacturer: Wurth Electronics; Current Rating: 3A; Voltage Rating: 250V; Number of Positions: 6; Gender: Male; Connector Type: Male Pin; Pitch: 0.1inch; Supplier 1: Newark; Manufacturer Part Number: 61300611121; RoHS: Yes; Category: Headers and Wire Housings; Stock 1: 4996; Pricing 1: 1=0.34000, 10=0.28900, 25=0.24000, 50=0.20100, 100=0.18200 (USD); Mount: Through Hole; Contact Plating: Gold; Contact Material: Copper Alloy,Copper; Housing Material: PBT; Color: Black; Min Operating Temperature: -40°C; Max Operating Temperature: 125°C; Number of Rows: 1; Contact Gender: Male; Packaging: Bulk; Termination: Through Hole; Number of Contacts: 6; Series: WR-PHD; Contact Type: Male Pin; Contact Mating Length: 0.236inch; REACH SVHC: Unknown; Lead Free: Lead Free; RoHS Compliant: Yes; ComponentLink1URL: http://www.mouser.com/ds/2/445/6130xx11121-538006.pdf?src-supplier=Mouser; ComponentLink1Description: http://www.mouser.com/ds/2/445/6130xx11121-538006.pdf?src-supplier=Mouser; ComponentLink2URL: http://www.farnell.com/cad/1737268.pdf?src-supplier=Element14; ComponentLink2Description: http://www.farnell.com/cad/1737268.pdf?src-supplier=Element14; ComponentLink3URL: https://katalog.we-online.de/em/datasheet/6130xx11121.pdf?src-supplier=Digi-Key; ComponentLink3Description: https://katalog.we-online.de/em/datasheet/6130xx11121.pdf?src-supplier=Digi-Key; Supplier Part Number 1: 20X0957

## Sheet DRIVER.SchDoc
size A4; DocumentNumber: 3; SheetNumber: 3; SheetTotal: 6
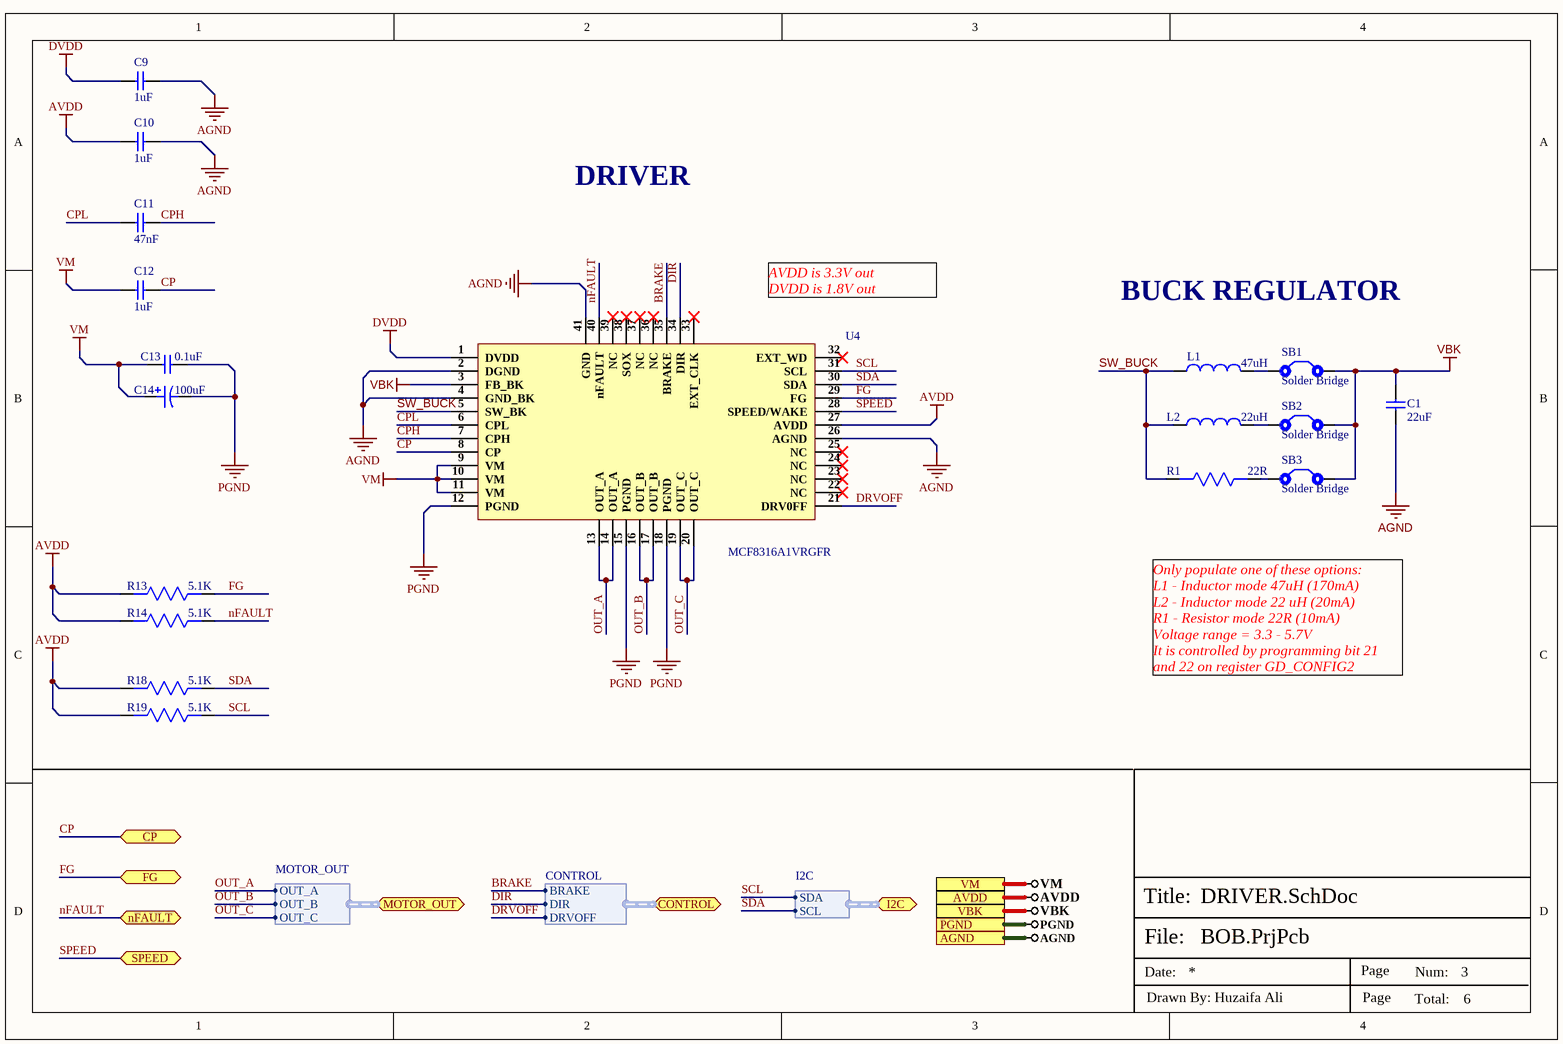
[diagram p5: DRIVER.SchDoc]

### Parts
C1  22uF  [Cap-0603]
C9  1uF  [Cap-0603]
C10  1uF  [Cap-0603]
C11  47nF  [Cap-0603]
C12  1uF  [Cap-0603]
C13  0.1uF  [Cap-0603]
C14  100uF  [Case-E]
L1  47uH  [IND-0603 (1608 Metric)]
L2  22uH  [IND-0603 (1608 Metric)]
R1  22R  [Res-0603]
R13  5.1K  [Res-0603]
R14  5.1K  [Res-0603]
R18  5.1K  [Res-0603]
R19  5.1K  [Res-0603]
SB1  Solder Bridge  [Solder Bridge]
SB2  Solder Bridge  [Solder Bridge]
SB3  Solder Bridge  [Solder Bridge]
U4  MCF8316A1VRGFR  [40-VQFN (7x5)]

### Ports
AGND, AVDD, CONTROL (bidir, harness CONTROL), CP (bidir), FG (bidir), I2C (bidir, harness I2C), MOTOR_OUT (bidir, harness MOTOR_OUT), nFAULT (bidir), PGND, SPEED (bidir), VBK, VM

### Harnesses
I2C: SDA, SCL
CONTROL: BRAKE, DIR, DRVOFF
MOTOR_OUT: OUT_A, OUT_B, OUT_C

### Nets
AGND: C1.1 C9.1 C10.1 U4.2(DGND) U4.4(GND_BK) U4.26(AGND) U4.41(GND) ; port AGND
AVDD: C10.2 R13.2 R14.2 R18.2 R19.2 U4.27(AVDD) ; port AVDD
DVDD: C9.2 U4.1(DVDD)
PGND: C13.2 C14.2 U4.12(PGND) U4.15(PGND) U4.18(PGND) ; port PGND
VBK: C1.2 SB1.2 SB2.2 SB3.2 U4.3(FB_BK) ; port VBK
VM: C12.1 C13.1 C14.1 U4.9(VM) U4.10(VM) U4.11(VM) ; port VM
BRAKE: U4.35(BRAKE) ; port CONTROL.BRAKE
CP: C12.2 U4.8(CP) ; port CP
CPH: C11.2 U4.7(CPH)
CPL: C11.1 U4.6(CPL)
DIR: U4.34(DIR) ; port CONTROL.DIR
DRVOFF: U4.21(DRV0FF) ; port CONTROL.DRVOFF
FG: R13.1 U4.29(FG) ; port FG
nFAULT: R14.1 U4.40(nFAULT) ; port nFAULT
OUT_A: U4.13(OUT_A) U4.14(OUT_A) ; port MOTOR_OUT.OUT_A
OUT_B: U4.16(OUT_B) U4.17(OUT_B) ; port MOTOR_OUT.OUT_B
OUT_C: U4.19(OUT_C) U4.20(OUT_C) ; port MOTOR_OUT.OUT_C
SCL: R19.1 U4.31(SCL) ; port I2C.SDA
SDA: R18.1 U4.30(SDA) ; port I2C.SCL
SPEED: U4.28(SPEED/WAKE) ; port SPEED
SW_BUCK: L1.1 L2.1 R1.2 U4.5(SW_BK)
NetL1_2: L1.2 SB1.1
NetL2_2: L2.2 SB2.1
NetR1_1: R1.1 SB3.1

Not connected (* = marked no-connect by the designer): U4 22(NC)* 23(NC)* 24(NC)* 25(NC)* 32(EXT_WD)* 33(EXT_CLK)* 36(NC)* 37(NC)* 38(SOX)* 39(NC)*

### Notes on the sheet
- DRIVER
- (near U4) AVDD is 3.3V out
  DVDD is 1.8V out
- BUCK REGULATOR
- Only populate one of these options:
  L1 - Inductor mode 47uH (170mA)
  L2 - Inductor mode 22 uH (20mA)
  R1 - Resistor mode 22R (10mA)
  Voltage range = 3.3 - 5.7V
  It is controlled by programming bit 21 and 22 on register GD_CONFIG2
- File:
- Title:
- Date:
- Page
- Num:
- Total:
- Drawn By: Huzaifa Ali

### Library data of the parts
C1 = CC0603MRX5R6BB226: CAP CER 22UF 10V X5R 0603; Manufacturer: Yageo; Tolerance: 20%; Supplier 1: Digi-Key; Manufacturer Part Number: CC0603MRX5R6BB226; RoHS: Yes; Category: Ceramic Capacitors; Stock 1: 19628; Pricing 1: 1=0.68000, 10=0.48000, 50=0.36300, 100=0.31610, 500=0.23416, 1000=0.19903 (USD); Mount: Surface Mount; Case/Package: 0603; Case Code (Metric): 1608; Case Code (Imperial): 0603; Weight: 7.1E-05oz; Min Operating Temperature: -55°C; Max Operating Temperature: 85°C; Packaging: Tape and Reel; Capacitance: 22uF; Voltage Rating: 10V; Dielectric: X5R; Termination: SMD/SMT; Voltage Rating (DC): 10V; Package Quantity: 4000; Length: 0.063inch; Width: 0.8mm; Height: 0.8mm; Thickness: 0.035inch; Lead Free: Lead Free; Halogen Free: Halogen Free; RoHS Compliant: Yes; ComponentLink1URL: http://www.mouser.com/ds/2/447/Yageo_UPY-GP_NP0_16V-to-50V_9-358835.pdf?src-supplier=Mouser; ComponentLink1Description: http://www.mouser.com/ds/2/447/Yageo_UPY-GP_NP0_16V-to-50V_9-358835.pdf?src-supplier=Mouser; ComponentLink2URL: http://www.yageo.com/documents/recent/UPY-GPHC_X5R_4V-to-50V_25.pdf?src-supplier=Digi-Key; ComponentLink2Description: http://www.yageo.com/documents/recent/UPY-GPHC_X5R_4V-to-50V_25.pdf?src-supplier=Digi-Key; Supplier Part Number 1: 311-1819-1-ND; LCSC Part Number: C109447
C9 C10 = CC0603KRX5R8BB105: CAP CER 1UF 25V X5R 0603; Manufacturer: Yageo; Tolerance: 10%; Supplier 1: Digi-Key; Manufacturer Part Number: CC0603KRX5R8BB105; RoHS: Yes; Category: Ceramic Capacitors; Stock 1: 919939; Pricing 1: 1=0.12000, 10=0.08400, 50=0.04760, 100=0.03940, 500=0.02764, 1000=0.02288 (USD); Mount: Surface Mount; Case/Package: 0603; Number of Pins: 2; Case Code (Metric): 1608; Case Code (Imperial): 0603; Min Operating Temperature: -55°C; Max Operating Temperature: 85°C; Capacitance: 1uF; Dielectric: X5R; Package Quantity: 1; Voltage Rating: 25V; Packaging: Tape and Reel; Termination: SMD/SMT; Voltage Rating (DC): 25V; Series: CC; Construction: Flat; Length: 1.6mm; Width: 0.031inch; Height: 0.8mm; Thickness: 0.035inch; Depth: 0.8mm; Radiation Hardening: No; REACH SVHC: No SVHC; Lead Free: Lead Free; Halogen Free: Halogen Free; RoHS Compliant: Yes; ComponentLink1URL: https://datasheet.ciiva.com/176/mlccorderingcode-176785.pdf?src-supplier=Digi-Key; ComponentLink1Description: https://datasheet.ciiva.com/176/mlccorderingcode-176785.pdf?src-supplier=Digi-Key; ComponentLink2URL: https://datasheet.ciiva.com/176/mlccorderingcode-176786.pdf?src-supplier=Digi-Key; ComponentLink2Description: https://datasheet.ciiva.com/176/mlccorderingcode-176786.pdf?src-supplier=Digi-Key; ComponentLink3URL: https://datasheet.ciiva.com/176/mlccorderingcode-176787.pdf?src-supplier=Digi-Key; ComponentLink3Description: https://datasheet.ciiva.com/176/mlccorderingcode-176787.pdf?src-supplier=Digi-Key; ComponentLink4URL: https://datasheet.ciiva.com/17436/upy-gphc-x5r-4v-to-50v-12-17436952.pdf?src-supplier=Avnet+Europe; ComponentLink4Description: https://datasheet.ciiva.com/17436/upy-gphc-x5r-4v-to-50v-12-17436952.pdf?src-supplier=Avnet+Europe; ComponentLink5URL: https://datasheet.ciiva.com/7978/1525783-7978171.pdf?src-supplier=Element14; ComponentLink5Description: https://datasheet.ciiva.com/7978/1525783-7978171.pdf?src-supplier=Element14; ComponentLink6URL: https://datasheet.ciiva.com/11586/upy-gphc-x5r-4v-to-50v-12-11586318.pdf?src-supplier=Avnet; ComponentLink6Description: https://datasheet.ciiva.com/11586/upy-gphc-x5r-4v-to-50v-12-11586318.pdf?src-supplier=Avnet; Supplier Part Number 1: 311-1445-1-ND; LCSC Part Number: C14664
C11 = CGA3E2X8R1H473M080AA: CAP CER 0.047UF 50V X8R 0603; Manufacturer: TDK; Tolerance: 20%; Supplier 1: Digi-Key; Manufacturer Part Number: CGA3E2X8R1H473M080AA; RoHS: Yes; Category: Ceramic Capacitors; Stock 1: 1279; Pricing 1: 1=0.16000, 10=0.11200, 50=0.06360, 100=0.05260, 500=0.03690, 1000=0.03055 (USD); Mount: Surface Mount; Case/Package: 0603; Case Code (Metric): 1608; Weight: 7.1E-05oz; Case Code (Imperial): 0603; Min Operating Temperature: -55°C; Max Operating Temperature: 150°C; Dielectric: X8R; Voltage Rating (DC): 50V; Package Quantity: 4000; Packaging: Tape and Reel; Capacitance: 47nF; Voltage Rating: 50V; Features: High Temperature; Length: 0.063inch; Width: 0.031inch; Height: 0.8mm; Thickness: 0.035inch; Ratings: AEC-Q200; ComponentLink1URL: http://www.mouser.com/ds/2/400/mlcc_automotive_hightemp_en-520039.pdf?src-supplier=Mouser; ComponentLink1Description: http://www.mouser.com/ds/2/400/mlcc_automotive_hightemp_en-520039.pdf?src-supplier=Mouser; ComponentLink2URL: https://product.tdk.com/info/en/catalog/spec/mlccspec_automotive_hightemp_en.pdf?src-supplier=Digi-Key; ComponentLink2Description: https://product.tdk.com/info/en/catalog/spec/mlccspec_automotive_hightemp_en.pdf?src-supplier=Digi-Key; ComponentLink3URL: http://product.tdk.com/en/catalog/datasheets/mlcc_automotive_hightemp_en.pdf?src-supplier=Avnet; ComponentLink3Description: http://product.tdk.com/en/catalog/datasheets/mlcc_automotive_hightemp_en.pdf?src-supplier=Avnet; Supplier Part Number 1: 445-12603-1-ND; LCSC Part Number: C2172709
C12 = UMK107AB7105KA-T: CAP CER 1UF 50V X7R 0603; Manufacturer: Taiyo Yuden; Tolerance: 10%; ComponentLink1URL: http://www.farnell.com/datasheets/2048165.pdf?src-supplier=Element14; ComponentLink1Description: http://www.farnell.com/datasheets/2048165.pdf?src-supplier=Element14; ComponentLink2URL: https://www.murata.com/~/media/webrenewal/support/library/catalog/products/capacitor/mlcc/c02e.ashx?la=en-us&src-supplier=Digi-Key; ComponentLink2Description: https://www.murata.com/~/media/webrenewal/support/library/catalog/products/capacitor/mlcc/c02e.ashx?la=en-us&src-supplier=Digi-Key; Supplier 1: Digi-Key; Manufacturer Part Number: UMK107AB7105KA-T; Stock 1: 453098; Pricing 1: 1=0.28, 10=0.19, 100=0.1079, 500=0.0762, 1000=0.0667 (USD); Mount: Surface Mount; Case/Package: 0603; Case Code (Metric): 1608; Case Code (Imperial): 0603; Min Operating Temperature: -55°C; Max Operating Temperature: 125°C; Packaging: Tape and Reel; Package Quantity: 1; Capacitance: 1uF; Voltage Rating: 50V; Voltage Rating (DC): 50V; Dielectric: X7R; Termination: SMD/SMT; Length: 1.6mm; Height: 0.8mm; Width: 0.031inch; Thickness: 0.037inch; Depth: 0.8mm; Radiation Hardening: No; Halogen Free: Halogen Free; ComponentLink3URL: https://www.yuden.co.jp/productdata/catalog/mlcc_all_e.pdf?src-supplier=Digi-Key; ComponentLink3Description: https://www.yuden.co.jp/productdata/catalog/mlcc_all_e.pdf?src-supplier=Digi-Key; ComponentLink4URL: https://www.yuden.co.jp/productdata/catalog/mlcc_all_e.pdf?src-supplier=Onlinecomponents.com; ComponentLink4Description: https://www.yuden.co.jp/productdata/catalog/mlcc_all_e.pdf?src-supplier=Onlinecomponents.com; Supplier Part Number 1: 587-3247-1-ND; LCSC Part Number: C105174
C13 = CC0603KRX7R0BB104: as C17 on sheet Encoder; Supplier 1: Digi-Key; Manufacturer Part Number: CC0603KRX7R0BB104; RoHS: Yes; Category: Ceramic Capacitors; Stock 1: 60476; Pricing 1: 1=0.19000, 10=0.13500, 50=0.07680, 100=0.06370, 500=0.04466, 1000=0.03696 (USD); Mount: Surface Mount; Case/Package: 0603; Case Code (Metric): 1608; Case Code (Imperial): 0603; Weight: 7.1E-05oz; Min Operating Temperature: -55°C; Max Operating Temperature: 125°C; Package Quantity: 4000; Voltage Rating: 100V; Packaging: Tape and Reel; Dielectric: X7R; Termination: SMD/SMT; Resistor Type: Ceramic; Voltage Rating (DC): 100V; Series: CC; Length: 0.063inch; Width: 0.031inch; Thickness: 0.035inch; Depth: 0.8mm; Lead Free: Lead Free; RoHS Compliant: Yes; ComponentLink1URL: https://datasheet.ciiva.com/6277/mlccorderingcode-6277030.pdf?src-supplier=Digi-Key; ComponentLink1Description: https://datasheet.ciiva.com/6277/mlccorderingcode-6277030.pdf?src-supplier=Digi-Key; ComponentLink2URL: https://datasheet.ciiva.com/6277/mlccorderingcode-6277081.pdf?src-supplier=Digi-Key; ComponentLink2Description: https://datasheet.ciiva.com/6277/mlccorderingcode-6277081.pdf?src-supplier=Digi-Key; ComponentLink3URL: https://datasheet.ciiva.com/6277/mlccorderingcode-6277082.pdf?src-supplier=Digi-Key; ComponentLink3Description: https://datasheet.ciiva.com/6277/mlccorderingcode-6277082.pdf?src-supplier=Digi-Key; Supplier Part Number 1: 311-1523-1-ND; LCSC Part Number: C113803
C14 = TAJE107M025RNJ: CAP TANT 100UF 20% 25V 2917; Manufacturer: Kyocera AVX; ESR (Equivalent Series Resistance): 300mR; Leakage Current: 25uA; Polarity: Polar; Dissipation Factor: 10%; Supplier 1: Mouser; Manufacturer Part Number: TAJE107M025RNJ; RoHS: Yes; Category: Tantalum Capacitors; Stock 1: 109; Pricing 1: 1=2.81000, 10=2.81000, 50=2.81000, 100=2.19000, 1000=1.76000, 10000=1.76000 (USD); Mount: Surface Mount; Case/Package: 2917; Number of Pins: 2; Case Code (Imperial): 2917; Case Code (Metric): 7343; Min Operating Temperature: -55°C; Max Operating Temperature: 125°C; Capacitance: 100uF; Tolerance: 20%; Packaging: Tape and Reel; Voltage Rating: 25V; Voltage Rating (DC): 25V; Features: General Purpose; Package Quantity: 1; Termination: SMD/SMT; Series: TAJ; Construction: Flat; Length: 7.3mm; Width: 4.3mm; Height: 4.3mm; Depth: 4.3mm; Height - Seated (Max): 0.169inch; Radiation Hardening: No; Lead Free: Lead Free; RoHS Compliant: Yes; REACH SVHC: No SVHC; ComponentLink1URL: https://datasheet.ciiva.com/26787/taje107m025rnj-26787048.pdf?src-supplier=IIIC; ComponentLink1Description: https://datasheet.ciiva.com/26787/taje107m025rnj-26787048.pdf?src-supplier=IIIC; ComponentLink2URL: https://datasheet.ciiva.com/265/taj-265541.pdf?src-supplier=Digi-Key; ComponentLink2Description: https://datasheet.ciiva.com/265/taj-265541.pdf?src-supplier=Digi-Key; ComponentLink3URL: https://datasheet.ciiva.com/265/taj-265542.pdf?src-supplier=Digi-Key; ComponentLink3Description: https://datasheet.ciiva.com/265/taj-265542.pdf?src-supplier=Digi-Key; ComponentLink4URL: https://datasheet.ciiva.com/265/taj-265540.pdf?src-supplier=Digi-Key; ComponentLink4Description: https://datasheet.ciiva.com/265/taj-265540.pdf?src-supplier=Digi-Key; ComponentLink5URL: https://datasheet.ciiva.com/28609/1719052-28609254.pdf?src-supplier=Element14; ComponentLink5Description: https://datasheet.ciiva.com/28609/1719052-28609254.pdf?src-supplier=Element14; ComponentLink6URL: https://datasheet.ciiva.com/11230/taj-11230456.pdf?src-supplier=Avnet; ComponentLink6Description: https://datasheet.ciiva.com/11230/taj-11230456.pdf?src-supplier=Avnet; ComponentLink7URL: https://datasheet.ciiva.com/17339/taj-17339677.pdf?src-supplier=Avnet+Europe; ComponentLink7Description: https://datasheet.ciiva.com/17339/taj-17339677.pdf?src-supplier=Avnet+Europe; ComponentLink8URL: https://datasheet.ciiva.com/22667/1719052-22667581.pdf?src-supplier=Element14; ComponentLink8Description: https://datasheet.ciiva.com/22667/1719052-22667581.pdf?src-supplier=Element14; Supplier Part Number 1: 581-TAJE107M025RNJ; LCSC Part Number: C7230
L1 = GLFR1608T470M-LR: 47uH ±20% 0603 Inductors (SMD) ROHS
L2 = CMI160808J220KT: 22uH ±10% 0603 Inductors (SMD) ROHS
R1 = CRCW060322R0JNEAHP: RES SMD 22 OHM 5% 1/3W 0603; Manufacturer: Vishay Dale; Temperature Coefficient: 200ppm/°C; Power Rating: 250mW; Voltage Rating: 75V; Supplier 1: Digi-Key; Manufacturer Part Number: CRCW060322R0JNEAHP; Stock 1: 245392; Pricing 1: 1=0.15, 10=0.129, 100=0.0506, 1000=0.02119, 2500=0.01942 (USD); Mount: Surface Mount; Case/Package: 0603; Weight: 7.1E-05oz; Contact Plating: Tin; Case Code (Imperial): 0603; Case Code (Metric): 1608; Min Operating Temperature: -55°C; Max Operating Temperature: 155°C; Resistance: 22R; Tolerance: 5%; Composition: Thick Film; Packaging: Tape and Reel; Package Quantity: 5000; Military Standard: Not; Length: 1.6mm; Height: 0.45mm; Width: 0.8mm; Depth: 0.85mm; Radiation Hardening: No; Lead Free: Lead Free; ComponentLink1URL: http://www.vishay.com/docs/20043/crcwhpe3.pdf?src-supplier=Avnet+Europe; ComponentLink1Description: http://www.vishay.com/docs/20043/crcwhpe3.pdf?src-supplier=Avnet+Europe; ComponentLink2URL: http://www.mouser.com/ds/2/427/dcrcwe3-109170.pdf?src-supplier=Mouser; ComponentLink2Description: http://www.mouser.com/ds/2/427/dcrcwe3-109170.pdf?src-supplier=Mouser; Supplier Part Number 1: 541-22SACT-ND
R13 R14 R18 R19 = RC0603JR-075K1L: as R7 on sheet Encoder; Supplier 1: Digi-Key; Manufacturer Part Number: RC0603JR-075K1L; RoHS: Yes; Category: Chip SMD Resistors; Stock 1: 245818; Pricing 1: 1=0.10000, 10=0.02000, 100=0.00800, 1000=0.00360, 2500=0.00312 (USD); Case/Package: 0603; Number of Pins: 2; Case Code (Imperial): 0603; Case Code (Metric): 1608; Size Code: 0603; Min Operating Temperature: -55°C; Max Operating Temperature: 155°C; Tolerance: 5%; Packaging: Tape and Reel; Termination: SMD/SMT; Resistor Type: Thick Film; Voltage Rating (DC): 50V; Features: Moisture Resistant; Series: RC; Max Power Dissipation: 100mW; Number of Terminations: 2; Resistance Tolerance: 5%; Construction: Rectangular; Length: 1.6mm; Depth: 0.8mm; REACH SVHC: No SVHC; Military Standard: Not; Lead Free: Lead Free; RoHS Compliant: Yes; ComponentLink1URL: http://www.mouser.com/ds/2/447/RC0603-272842.pdf?src-supplier=Mouser; ComponentLink1Description: http://www.mouser.com/ds/2/447/RC0603-272842.pdf?src-supplier=Mouser; ComponentLink2URL: http://components.arrow.com/part/dataview/0323_00047491?src-supplier=Arrow+Europe; ComponentLink2Description: http://components.arrow.com/part/dataview/0323_00047491?src-supplier=Arrow+Europe; ComponentLink3URL: http://www.farnell.com/datasheets/2167052.pdf?src-supplier=Farnell; ComponentLink3Description: http://www.farnell.com/datasheets/2167052.pdf?src-supplier=Farnell; ComponentLink4URL: http://www.farnell.com/datasheets/2167052.pdf?src-supplier=Element14; ComponentLink4Description: http://www.farnell.com/datasheets/2167052.pdf?src-supplier=Element14; ComponentLink5URL: http://www.farnell.com/datasheets/2167052.pdf?src-supplier=Newark; ComponentLink5Description: http://www.farnell.com/datasheets/2167052.pdf?src-supplier=Newark; ComponentLink6URL: http://www.farnell.com/datasheets/1868787.pdf?src-supplier=Newark; ComponentLink6Description: http://www.farnell.com/datasheets/1868787.pdf?src-supplier=Newark; ComponentLink7URL: http://www.yageo.com/documents/recent/PYu-RC_Group_51_RoHS_L_10.pdf?src-supplier=Digi-Key; ComponentLink7Description: http://www.yageo.com/documents/recent/PYu-RC_Group_51_RoHS_L_10.pdf?src-supplier=Digi-Key; ComponentLink8URL: http://www.yageo.com/documents/recent/PYu-RC0603_51_RoHS_L_7.pdf?src-supplier=Future+Electronics; ComponentLink8Description: http://www.yageo.com/documents/recent/PYu-RC0603_51_RoHS_L_7.pdf?src-supplier=Future+Electronics; Supplier Part Number 1: 311-5.1KGRCT-ND; LCSC Part Number: C14677
SB1-SB3 = Solder Bridge: Solder Bridge ON
U4 = MCF8316A1VRGFR: 40-V max, 8-A peak, sensorless FOC control 3-phase BLDC motor driver 40-VQFN -40 to 125; Manufacturer: Texas Instruments; Supplier 1: Mouser; RoHS: No; Stock 1: 889; Pricing 1: 1=5.48000, 10=4.92000, 25=4.65000, 50=4.65000, 100=4.04000, 250=3.83000, 500=3.44000, 1000=3.00000, 10000=3.00000 (USD); Supplier Part Number 1: 595-MCF8316A1VRGFR; Manufacturer Part Number: MCF8316A1VRGFR